# Altium schematic sheet Microcontroller.SchDoc
size B; SheetNumber: 2; SheetTotal: 6
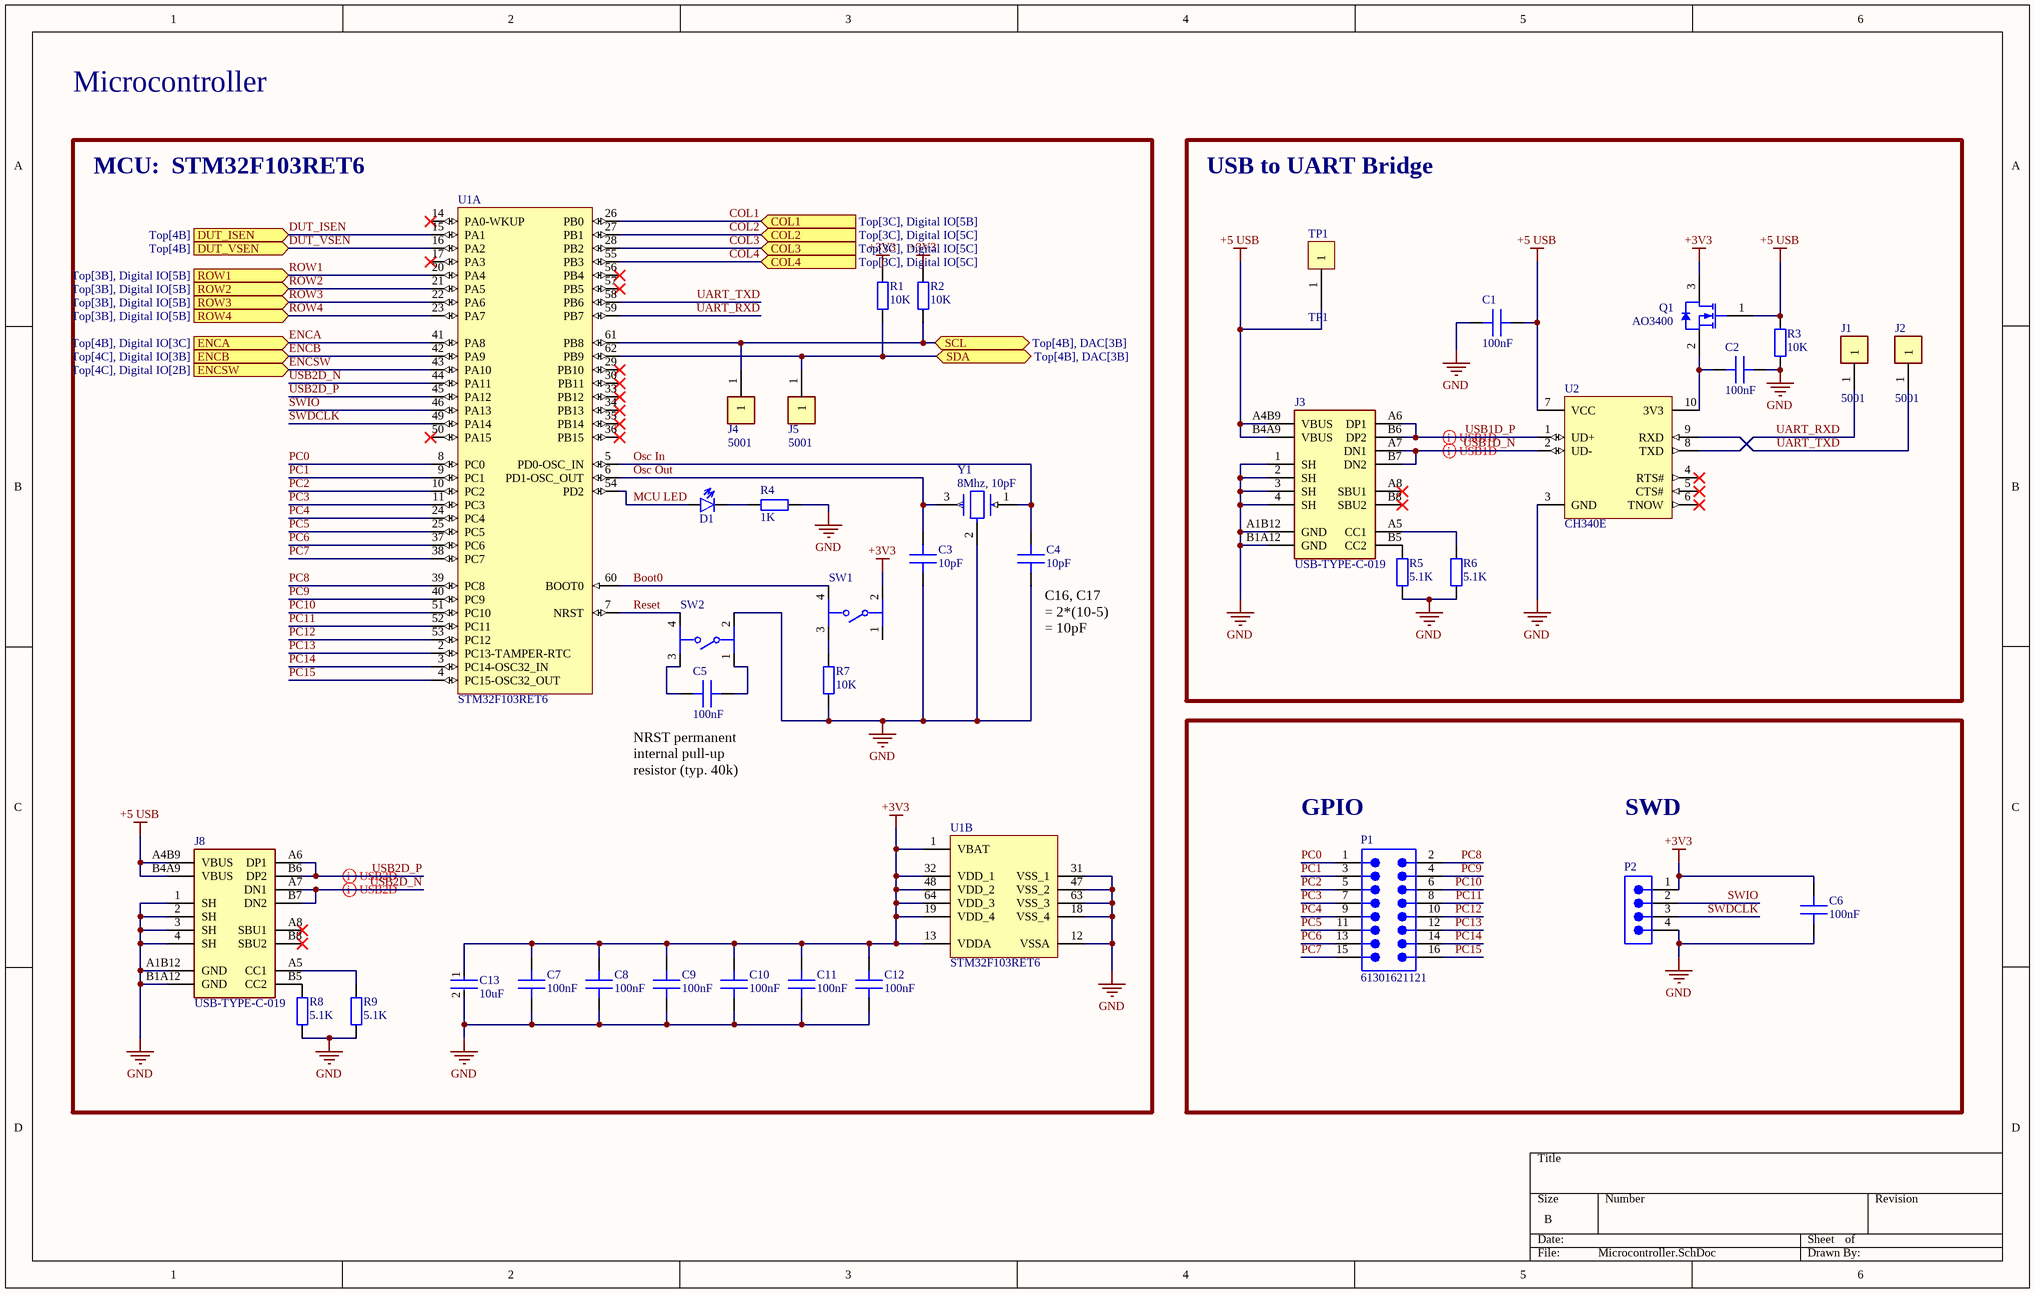
[diagram p0: Microcontroller.SchDoc]

## Parts
C1  100nF  [IPC C C0402 NO SILK]
C2  100nF  [IPC C C0402 NO SILK]
C3  10pF  [IPC C C0402 NO SILK]
C4  10pF  [IPC C C0402 NO SILK]
C5  100nF  [IPC C C0402 NO SILK]
C6  100nF  [IPC C C0402 NO SILK]
C7  100nF  [IPC C C0402 NO SILK]
C8  100nF  [IPC C C0402 NO SILK]
C9  100nF  [IPC C C0402 NO SILK]
C10  100nF  [IPC C C0402 NO SILK]
C11  100nF  [IPC C C0402 NO SILK]
C12  100nF  [IPC C C0402 NO SILK]
C13  10uF  [FP-GCM21B-0_15-MFG]
D1  CMP-006-000001-1  [IPC C D0603]  (value not drawn)
J1  5001  [FP-5001-MFG]
J2  5001  [FP-5001-MFG]
J3  USB-TYPE-C-019  [USB-TYPE-C-12+4P]
J4  5001  [FP-5001-MFG]
J5  5001  [FP-5001-MFG]
J8  USB-TYPE-C-019  [USB-TYPE-C-12+4P]
P1  61301621121  [61301621121]
P2  61300411121  [61300411121]  (value not drawn)
Q1  AO3400  [AO-SOT23-3_V]
R1  10K  [IPC C R0402 NO SILK]
R2  10K  [IPC C R0402 NO SILK]
R3  10K  [IPC C R0402 NO SILK]
R4  1K  [IPC C R0402 NO SILK]
R5  5.1K  [IPC C R0402 NO SILK]
R6  5.1K  [IPC C R0402 NO SILK]
R7  10K  [IPC C R0402 NO SILK]
R8  5.1K  [IPC C R0402 NO SILK]
R9  5.1K  [IPC C R0402 NO SILK]
SW1  C318884  [FP-PTS526SK15SMTR2LFS-MFG]  (value not drawn)
SW2  C318884  [FP-PTS526SK15SMTR2LFS-MFG]  (value not drawn)
TP1  TP1  [TP1]
U1  STM32F103RET6  [STM-LQFP64_N]  (parts A,B of 2)
U2  CH340E  [MSOP-UN10_L]
Y1  8Mhz, 10pF  [FP-CSTNE8M00GH5C000R0-MFG]

## Blocks framed on the sheet
MCU:  STM32F103RET6: C3-C5 C7-C13 D1 J4 J5 J8 R1 R2 R4 R7-R9 SW1 SW2 U1 Y1
USB to UART Bridge: C1 C2 J1-J3 Q1 R3 R5 R6 TP1 U2

## Ports
COL1 (in, see Top[3C], Digital IO[5B]), COL2 (in, see Top[3C], Digital IO[5C]), COL3 (in, see Top[3C], Digital IO[5C]), COL4 (in, see Top[3C], Digital IO[5C]), DUT_ISEN (in, see Top[4B]), DUT_VSEN (in, see Top[4B]), ENCA (in, see Top[4B], Digital IO[3C]), ENCB (in, see Top[4C], Digital IO[3B]), ENCSW (in, see Top[4C], Digital IO[2B]), ROW1 (in, see Top[3B], Digital IO[5B]), ROW2 (in, see Top[3B], Digital IO[5B]), ROW3 (in, see Top[3B], Digital IO[5B]), ROW4 (in, see Top[3B], Digital IO[5B]), SCL (bidir, see Top[4B], DAC[3B]), SDA (bidir, see Top[4B], DAC[3B])

## Nets
+3V3: C6.1 C7.1 C8.1 C9.1 C10.1 C11.1 C12.1 C13.1 P2.1 Q1.3(D) R1.2 R2.2 SW1.2 U1.1(VBAT) U1.13(VDDA) U1.19(VDD_4) U1.32(VDD_1) U1.48(VDD_2) U1.64(VDD_3)
+5 USB: C1.1 J3.A4B9(VBUS) J3.B4A9(VBUS) J8.A4B9(VBUS) J8.B4A9(VBUS) Q1.1(G) R3.2 TP1.1 U2.7(VCC)
GND: C1.2 C2.1 C3.1 C4.1 C6.2 C7.2 C8.2 C9.2 C10.2 C11.2 C12.2 C13.2 J3.1(SH) J3.2(SH) J3.3(SH) J3.4(SH) J3.A1B12(GND) J3.B1A12(GND) J8.1(SH) J8.2(SH) J8.3(SH) J8.4(SH) J8.A1B12(GND) J8.B1A12(GND) P2.4 R3.1 R4.1 R5.1 R6.1 R7.1 R8.1 R9.1 SW2.2 U1.12(VSSA) U1.18(VSS_4) U1.31(VSS_1) U1.47(VSS_2) U1.63(VSS_3) U2.3(GND) Y1.2(GND)
Boot0: SW1.4 U1.60(BOOT0)
COL1: U1.26(PB0) ; port COL1
COL2: U1.27(PB1) ; port COL2
COL3: U1.28(PB2) ; port COL3
COL4: U1.55(PB3) ; port COL4
DUT_ISEN: U1.15(PA1) ; port DUT_ISEN
DUT_VSEN: U1.16(PA2) ; port DUT_VSEN
ENCA: U1.41(PA8) ; port ENCA
ENCB: U1.42(PA9) ; port ENCB
ENCSW: U1.43(PA10) ; port ENCSW
MCU LED: D1.1(A) U1.54(PD2)
Osc In: C4.2 U1.5(PD0-OSC_IN) Y1.1(Input)
Osc Out: C3.2 U1.6(PD1-OSC_OUT) Y1.3(Output)
PC0: P1.1 U1.8(PC0)
PC1: P1.3 U1.9(PC1)
PC2: P1.5 U1.10(PC2)
PC3: P1.7 U1.11(PC3)
PC4: P1.9 U1.24(PC4)
PC5: P1.11 U1.25(PC5)
PC6: P1.13 U1.37(PC6)
PC7: P1.15 U1.38(PC7)
PC8: P1.2 U1.39(PC8)
PC9: P1.4 U1.40(PC9)
PC10: P1.6 U1.51(PC10)
PC11: P1.8 U1.52(PC11)
PC12: P1.10 U1.53(PC12)
PC13: P1.12 U1.2(PC13-TAMPER-RTC)
PC14: P1.14 U1.3(PC14-OSC32_IN)
PC15: P1.16 U1.4(PC15-OSC32_OUT)
Reset: SW2.4 U1.7(NRST)
ROW1: U1.20(PA4) ; port ROW1
ROW2: U1.21(PA5) ; port ROW2
ROW3: U1.22(PA6) ; port ROW3
ROW4: U1.23(PA7) ; port ROW4
SCL: J4.1 R2.1 U1.61(PB8) ; port SCL
SDA: J5.1 R1.1 U1.62(PB9) ; port SDA
SWDCLK: P2.3 U1.49(PA14)
SWIO: P2.2 U1.46(PA13)
UART_RXD: J1.1 U1.59(PB7) U2.8(TXD)
UART_TXD: J2.1 U1.58(PB6) U2.9(RXD)
USB1D_N: J3.A7(DN1) J3.B7(DN2) U2.2(UD-)
USB1D_P: J3.A6(DP1) J3.B6(DP2) U2.1(UD+)
USB2D_N: J8.A7(DN1) J8.B7(DN2) U1.44(PA11)
USB2D_P: J8.A6(DP1) J8.B6(DP2) U1.45(PA12)
NetC2_2: C2.2 Q1.2(S) U2.10(3V3)
NetC5_1: C5.1 SW2.1
NetC5_2: C5.2 SW2.3
NetD1_2: D1.2(C) R4.2
NetJ3_A5: J3.A5(CC1) R6.2
NetJ3_B5: J3.B5(CC2) R5.2
NetJ8_A5: J8.A5(CC1) R9.2
NetJ8_B5: J8.B5(CC2) R8.2
NetR7_2: R7.2 SW1.3

Not connected (* = marked no-connect by the designer): J3 A8(SBU1)* B8(SBU2)*; J8 A8(SBU1)* B8(SBU2)*; SW1 1; U1 14(PA0-WKUP)* 17(PA3)* 29(PB10)* 30(PB11)* 33(PB12)* 34(PB13)* 35(PB14)* 36(PB15)* 50(PA15)* 56(PB4)* 57(PB5)*; U2 4(RTS#)* 5(CTS#)* 6(TNOW)*

## Layout directives
differential pair; differential pair class USB1D: USB1D_N, USB1D_P
differential pair; differential pair class USB2D: USB2D_N, USB2D_P

## Notes on the sheet
- Microcontroller
- (near C4) C16, C17 = 2*(10-5) = 10pF
- (near C5) NRST permanent internal pull-up resistor (typ. 40k)
- (near P1) GPIO
- SWD

## Library data of the parts
C1-C12 = CMP-002-000000-1: Source: Schlib1.SchLib; Design Item ID: Generic CAP 0402
  C1 C2 C5-C12: Value: 100nF
  C3 C4: Value: 10pF
C13 = CMP-06035-012904-1: Ceramic Capacitor for Automotive 10uF ±10% 6.3VDC X7R 0805 Embossed T/R GCM21BR70J106KE22K; Voltage Rating (DC): 6.3V; Lead Free: Lead Free; Length: 2mm; Case/Package: 0805; Packaging: Tape and Reel; Max Operating Temperature: 125°C; Depth: 1.25mm; Dielectric: X7R; Value: 10uF; Tolerance: 10%; Min Operating Temperature: -55°C
J1 J2 J4 J5 = CMP-2000-05181-2: PC TEST POINT MINIATURE BLACK; Body Material: Bronze; Plating: Silver; Inside Diameter: 1.27mm; Hole Diameter: 1.6mm; Number of Ports: 1; Outside Diameter: 2.54mm; Insulation: Insulated; Insulation Material: Nylon; Mount: Through Hole; RoHS Compliant: Yes; Series: THM; Height: 0.3inch; Termination: Through Hole; Material: Nylon; Packaging: Bulk; Contact Material: Bronze; REACH SVHC: No SVHC; Contact Plating: Silver; Orientation: Straight; Lead Free: Lead Free; Package Quantity: 100; Length: 7.62mm; Flammability Rating: UL94 V-0; Number of Contacts: 1; Diameter: 2.54mm; Housing Color: Black; Color: Black
J3 J8 = CMP-003-000000-1: Connector Type:Type-C Standard:- Gender:Female Number of Contacts:16 Number of Ports:1 Mounting Style:Surface Mount Current Rating - Power (Max):3A Operating Temperature Range:-25℃~+85℃ Operating Temperature Range:-25℃~+85℃; Manufacturer: DEALON(德艺隆); Add into BOM: yes; Connector Type: Type-C; Gender: Female; Number of Contacts: 16; Number of Ports: 1; Current Rating - Power (Max): 3A; Symbol: USB-TYPE-C-019; Device: USB-TYPE-C-019; LCSC Part Name: Type-C 母座 卧贴; Supplier Part: C2927039; Manufacturer Part: USB-TYPE-C-019; Supplier Footprint: SMD; JLCPCB Part Class: Extended Part; Datasheet: https://atta.szlcsc.com/upload/public/pdf/source/20211217/CCD3D517E355E8E0CC52ABD8D5784AD8.pdf; Convert to PCB: yes; Standard: -; Mounting Style: Surface Mount; Operating Temperature Range: -25℃~+85℃; Design Item ID: USB-TYPE-C-019; Source: Schlib1.SchLib
P1 = CMP-1502-01097-3: NexarPartId: 32855550; Contact Resistance: 20mΩ; Operating Supply Voltage: 250V; Number of Contacts: 16; Current Rating: 3A; Connector Type: Male Pin; Row Spacing: 2.54mm; Gender: Male; Min Operating Temperature: -40°C; Contact Material: Copper; RoHS: Compliant; Lead Pitch: 2.54mm; Color: Black; Contact Mating Length: 5.9944mm; REACH SVHC: Unknown; Number of Rows: 2; Orientation: Vertical; Number of Positions: 16; Max Operating Temperature: 105°C; Termination: Solder; Packaging: Bulk; Height: 8.89mm; Mount: Through Hole; Contact Plating: Gold; Voltage Rating: 250V; Number of Pins: 16; Pitch: 2.54mm
P2 = CMP-1502-01064-2: NexarPartId: 32855522; Pitch: 2.54mm; Number of Contacts: 4; Contact Resistance: 20mΩ; Gender: Male; Current Rating: 3A; Connector Type: Male Pin; Voltage Rating: 250V; Lead Free: Lead Free; Contact Plating: Gold; Max Operating Temperature: 105°C; Packaging: Bulk; Height: 8.89mm; Orientation: Vertical; Contact Mating Length: 5.9944mm; Contact Material: Copper; Lead Pitch: 2.54mm; Min Operating Temperature: -40°C; Termination: Solder; Color: Black; Number of Rows: 1; REACH SVHC: Unknown; RoHS: Compliant; Mount: Through Hole; Number of Positions: 4; Number of Pins: 4; Operating Supply Voltage: 250V
Q1 = CMP-0278-00001-1: N-channel Enhancement Mode Field-Effect Transistor; 5.8A/30V; Manufacturer: Alpha and Omega; Channel Type: N; Drain-Source Voltage Limit: 30 V; Junction Temperature: -55 to 150 degC; Gate-Source Voltage Limit: +/-12 V; PackageDescription: 3-Pin SOT23, 3.016 x 2.8 mm Body, 0.95 mm Pitch; ComponentLink2Description: Datasheet; DatasheetVersion: Rev.8, 12/2011; ComponentLink3URL: http://www.aosmd.com/res/packaging_information/SOT-23.pdf; Storage Temperature: -55 to 150 degC; ComponentLink3Description: Package Specification; PackageReference: SOT23; ComponentLink1Description: Manufacturer URL; Mounting Technology: Surface Mount; ComponentLink1URL: http://www.aosmd.com/; PartNumber: AO3400; ComponentLink2URL: http://www.aosmd.com/res/data_sheets/AO3400.pdf
R1-R9 = CMP-008-000000-1: Source: Schlib1.SchLib; Design Item ID: Generic RES 0402
  R1-R3 R7: Value: 10K
  R4: Value: 1K
  R5 R6 R8 R9: Value: 5.1K
SW1 SW2 = CMP-10040-000013-1: TACT 5.2 X 5.2, 1.5 MM H, 260GF, C318884; Manufacturer: C&K; Manufacturer Part Number: PTS526SK15SMTR2LFS; Operating Force: 250gf; Throw Configuration: SPST-NO; Contact Current Rating: 50mA; Standoff Height: 0mm; Contact Resistance: 100mΩ; Voltage Rating Dc: 12V; Electromechanical Life: 200000Cycles; Device Class L3: Tactile Switches; Device Class L2: Switches; Temperature: -20°C to +70°C; Temperature Range Low: -20°C; Package: PTS526SK15SMTR2LFS; Temperature Range High: +70°C; ComponentLink2Description: Datasheet; Device Class L1: Electromechanical; Height: 1.65mm; Digikey Description: TACT 5.2 X 5.2, 1.5 MM H, 260GF,; Category: Switch; RoHS: TRUE; Automotive: No; Lead Free: Yes; Octopart: https://octopart.com/pts526+sk15+smtr2+lfs-c%26k+components-100617999; ComponentLink2URL: https://www.ckswitches.com/media/2780/pts526.pdf
TP1 = CMP-00003-3: Testpoint double sided
U1 = CMP-0237-00201-3: ARM Cortex-M3 32-bit MCU, 512 KB Flash, 64 KB Internal RAM, 51 I/Os, 64-pin LQFP, -40 to 85 degC, Tray; FLASH Size (Prog) (kB): 512; Internal RAM Size (kB): 64; A/D Converter: 3x12-bit (16 Channel); I/Os (High Current): 51; Supply Voltage(Vcc) min (V): 2; D/A Converter: 2x12-bit (2 Channel); Operating Frequency(F) (Processor speed) (MHz): 72; PackageDescription: 64-Pin Low Profile Quad Flat Package, 10 x 10 mm Body, 0.5 mm Pitch; ComponentLink3URL: http://www.st.com/st-web-ui/static/active/en/resource/technical/document/datasheet/DM00037051.pdf; DatasheetVersion: Rev. 8; Packing: Tray; PackageReference: LQFP64; ComponentLink3Description: Package Specification; Core: ARM Cortex-M3; Mounting Technology: Surface Mount; PartNumber: STM32F103RET6; PackageVersion: Rev. 4, 06/2013; ComponentLink1URL: http://www.st.com/web/en/home.html; ComponentLink1Description: Manufacturer URL; ComponentLink2Description: Datasheet; ComponentLink2URL: http://www.st.com/st-web-ui/static/active/en/resource/technical/document/datasheet/CD00191185.pdf
U2 = CMP-010-000001-1: Source: Schlib1.SchLib; Design Item ID: CH340E
Y1 = CMP-06057-000001-1: MFR.Part # / CSTCE8M00G52-R0 Copy / JLCPCB Part # / C22549 Copy / Package / SMD3213-3P Copy / Description / 8MHz ±0.5% 10pF 40Ω SMD3213-3P Ceramic Resonators ROHS; Frequency Stability: 0.13%; Capacitance: 33pF; Frequency Tolerance: 0.07%; Impedance: 40R; Mount: Surface Mount; Min Operating Temperature: -40°C; Max Operating Temperature: 125°C; Resistor Type: Ceramic; Packaging: Tape and Reel; Frequency: 8MHz; Case/Package: SMD/SMT
D1 = CMP-006-000001-1: Design Item ID: Generic LED 0603; Source: Schlib1.SchLib